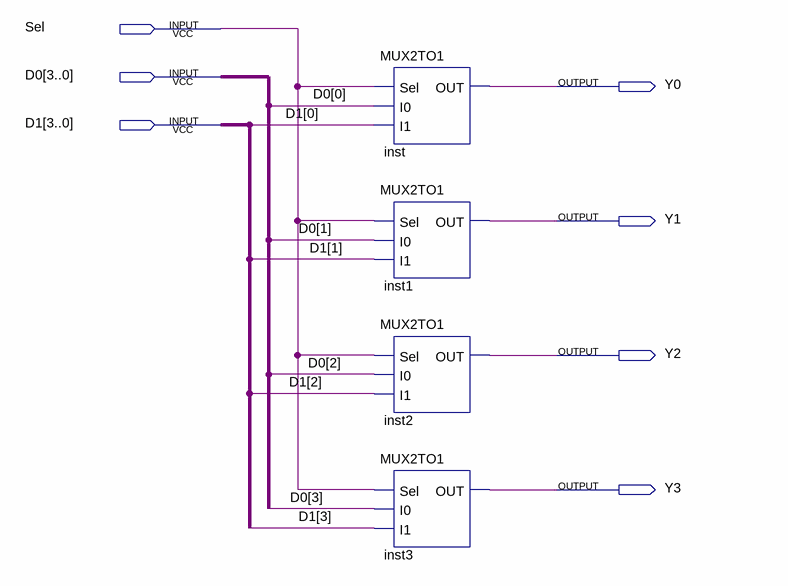
[diagram p0: schematic sheet]
// Quartus schematic MUX4TO14BIT.bdf as structural Verilog: 4 symbols, 7 pins
module MUX4TO14BIT (
  input  Sel,
  input  [3:0] D0,
  input  [3:0] D1,
  output Y0,
  output Y1,
  output Y2,
  output Y3
);

  MUX2TO1 inst (.Sel(Sel), .I0(D0[0]), .I1(D1[0]), .OUT(Y0));
  MUX2TO1 inst1 (.Sel(Sel), .I0(D0[1]), .I1(D1[1]), .OUT(Y1));
  MUX2TO1 inst2 (.Sel(Sel), .I0(D0[2]), .I1(D1[2]), .OUT(Y2));
  MUX2TO1 inst3 (.Sel(Sel), .I0(D0[3]), .I1(D1[3]), .OUT(Y3));
endmodule
